# Altium schematic sheet LDCFinal1.SchDoc
size A3; SheetNumber: 1; SheetTotal: 1
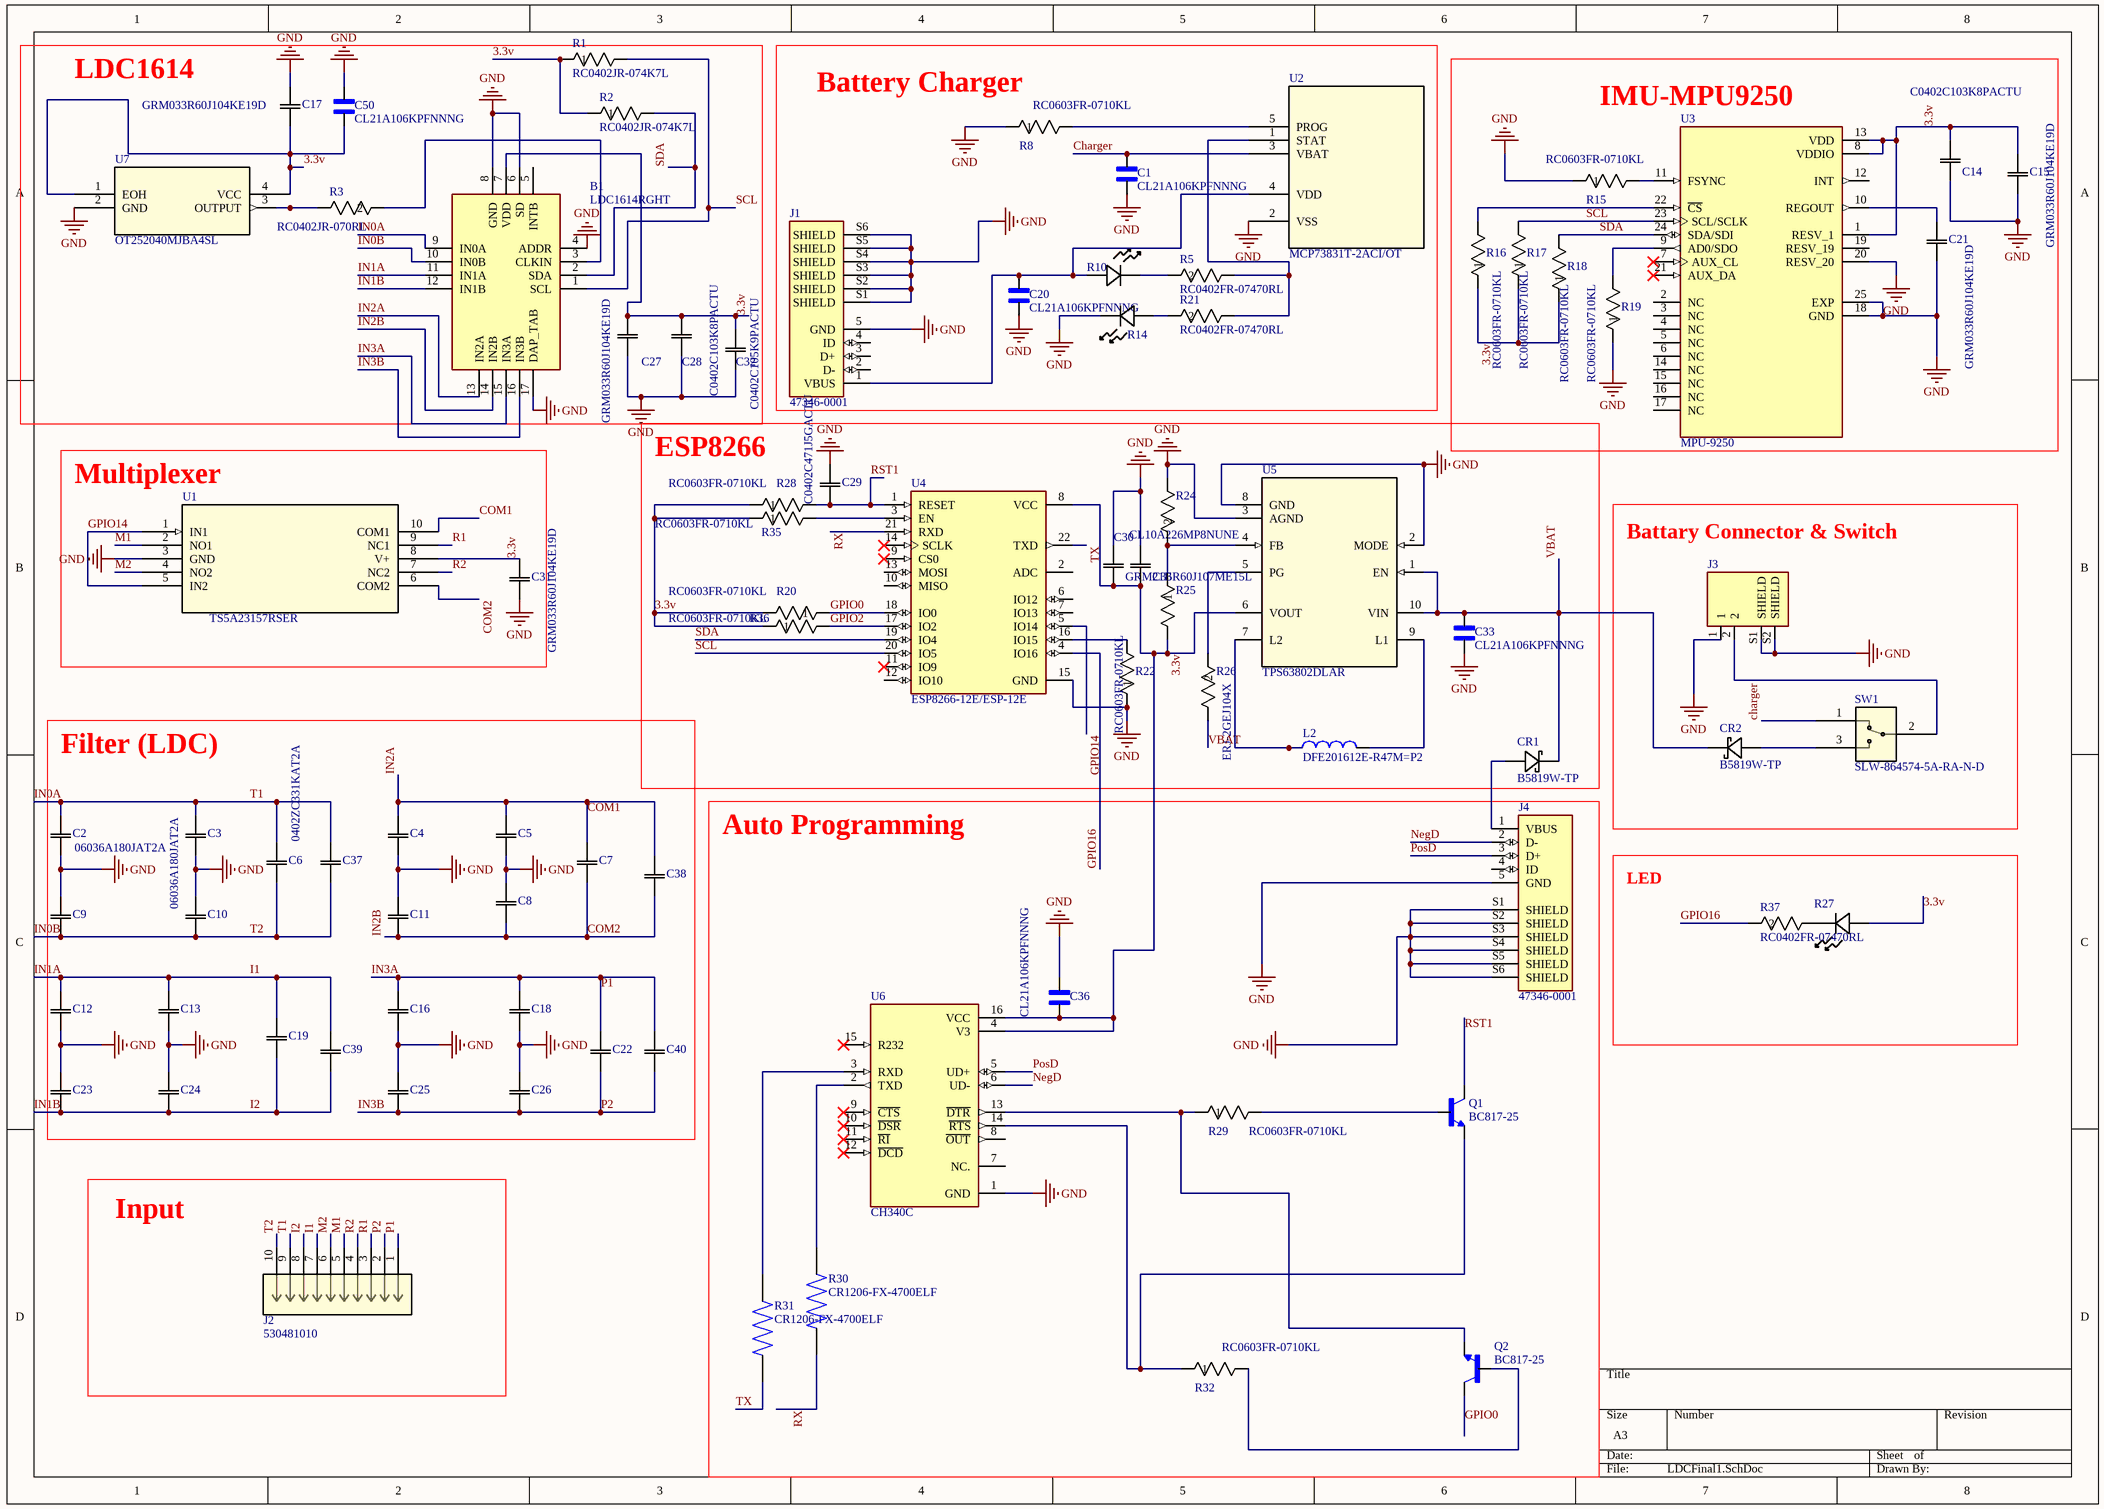
[diagram p0: LDCFinal1.SchDoc]

## Parts
B1  LDC1614RGHT  [QFN50P400X400X80-17N]
C1  CL21A106KPFNNNG  [CAPC2012X135N]
C2  06036A180JAT2A  [CAP_06033D104JAT2A]
C3  06036A180JAT2A  [CAP_06033D104JAT2A]
C4  06036A180JAT2A  [CAP_06033D104JAT2A]  (value not drawn)
C5  06036A180JAT2A  [CAP_06033D104JAT2A]  (value not drawn)
C6  0402ZC331KAT2A  [CAP_04026Z104KAT2A]
C7  0402ZC331KAT2A  [CAP_04026Z104KAT2A]  (value not drawn)
C8  06036A180JAT2A  [CAP_06033D104JAT2A]  (value not drawn)
C9  06036A180JAT2A  [CAP_06033D104JAT2A]  (value not drawn)
C10  06036A180JAT2A  [CAP_06033D104JAT2A]  (value not drawn)
C11  06036A180JAT2A  [CAP_06033D104JAT2A]  (value not drawn)
C12  06036A180JAT2A  [CAP_06033D104JAT2A]  (value not drawn)
C13  06036A180JAT2A  [CAP_06033D104JAT2A]  (value not drawn)
C14  C0402C103K8PACTU  [CAPC10555_55N_KEM-M]
C15  GRM033R60J104KE19D  [G-033_MUR]
C16  06036A180JAT2A  [CAP_06033D104JAT2A]  (value not drawn)
C17  GRM033R60J104KE19D  [G-033_MUR]
C18  06036A180JAT2A  [CAP_06033D104JAT2A]  (value not drawn)
C19  0402ZC331KAT2A  [CAP_04026Z104KAT2A]  (value not drawn)
C20  CL21A106KPFNNNG  [CAPC2012X135N]
C21  GRM033R60J104KE19D  [G-033_MUR]
C22  0402ZC331KAT2A  [CAP_04026Z104KAT2A]  (value not drawn)
C23  06036A180JAT2A  [CAP_06033D104JAT2A]  (value not drawn)
C24  06036A180JAT2A  [CAP_06033D104JAT2A]  (value not drawn)
C25  06036A180JAT2A  [CAP_06033D104JAT2A]  (value not drawn)
C26  06036A180JAT2A  [CAP_06033D104JAT2A]  (value not drawn)
C27  GRM033R60J104KE19D  [G-033_MUR]
C28  C0402C103K8PACTU  [CAPC10555_55N_KEM-M]
C29  C0402C471J5GACTU  [CAPC10555_55N_KEM]
C30  GRM21BR60J107ME15L  [CAP_GRM21B_MUR]
C31  GRM033R60J104KE19D  [G-033_MUR]
C32  C0402C105K9PACTU  [CAPC10555_55N_KEM]
C33  CL21A106KPFNNNG  [CAPC2012X135N]
C35  CL10A226MP8NUNE  [CAP_CL10_SAM]
C36  CL21A106KPFNNNG  [CAPC2012X135N]
C37  (no value)  [CAP_AR20_AVX]
C38  AR205F473K4R  [CAP_AR20_AVX]  (value not drawn)
C39  AR205F473K4R  [CAP_AR20_AVX]  (value not drawn)
C40  AR205F473K4R  [CAP_AR20_AVX]  (value not drawn)
C50  CL21A106KPFNNNG  [CAPC2012X135N]
CR1  B5819W-TP  [SDO_SOD-123_MCC]
CR2  B5819W-TP  [SDO_SOD-123_MCC]
J1  47346-0001  [MOLEX_47346-0001]
J2  530481010  [CONN10_530481010_MOL]
J3  S2B-PH-SM4-TB(LF)(SN)  [JST_S2B-PH-SM4-TB(LF)(SN)]  (value not drawn)
J4  47346-0001  [MOLEX_47346-0001]
L2  DFE201612E-R47M=P2  [INDC2016X120N]
Q1  BC817-25  [TRANS_BC817-25]
Q2  BC817-25  [TRANS_BC817-25]
R1  RC0402JR-074K7L  [RES_0402_YAG]
R2  RC0402JR-074K7L  [RES_0402_YAG]
R3  RC0402JR-070RL  [RC0402N_YAG]
R5  RC0402FR-07470RL  [RC0402N_YAG-M]
R8  RC0603FR-0710KL  [RC0603N_YAG-M]
R10  SML-D12M8WT86  [LED_SMLD12_ROM]  (value not drawn)
R14  SML-D12M8WT86  [LED_SMLD12_ROM]  (value not drawn)
R15  RC0603FR-0710KL  [RC0603N_YAG-M]
R16  RC0603FR-0710KL  [RC0603N_YAG-M]
R17  RC0603FR-0710KL  [RC0603N_YAG-M]
R18  RC0603FR-0710KL  [RC0603N_YAG-M]
R19  RC0603FR-0710KL  [RC0603N_YAG-M]
R20  RC0603FR-0710KL  [RC0603N_YAG-M]
R21  RC0402FR-07470RL  [RC0402N_YAG-M]
R22  RC0603FR-0710KL  [RC0603N_YAG-M]
R24  RC0603JR-0791KL  [RC0603N_YAG]  (value not drawn)
R25  RMCF0402FT511K  [RES_RMCF0402_STP]  (value not drawn)
R26  ERJ-2GEJ104X  [RC0402N_PAN]
R27  SML-D12M8WT86  [LED_SMLD12_ROM]  (value not drawn)
R28  RC0603FR-0710KL  [RC0603N_YAG-M]
R29  RC0603FR-0710KL  [RC0603N_YAG-M]
R30  CR1206-FX-4700ELF  [RESC3216X75N]
R31  CR1206-FX-4700ELF  [RESC3216X75N]
R32  RC0603FR-0710KL  [RC0603N_YAG-M]
R35  RC0603FR-0710KL  [RC0603N_YAG-M]
R36  RC0603FR-0710KL  [RC0603N_YAG-M]
R37  RC0402FR-07470RL  [RC0402N_YAG]
SW1  SLW-864574-5A-RA-N-D  [SLW-864574-5A-RA-N-D_SSD]
U1  TS5A23157RSER  [RSE10]
U2  MCP73831T-2ACI/OT  [SOT-23-5_MC_MCH]
U3  MPU-9250  [QFN40P300X300X105-25N]
U4  ESP8266-12E/ESP-12E  [XCVR_ESP8266-12E/ESP-12E]
U5  TPS63802DLAR  [DLA0010A]
U6  CH340C  [SOIC127P600X180-16N]
U7  OT252040MJBA4SL  [IC_625L3C040M00000_CTS]

## Blocks framed on the sheet
LDC1614: B1 C17 C27 C28 C32 C50 R1-R3 U7
Battery Charger: C1 C20 J1 R5 R8 R10 R14 R21 U2
IMU-MPU9250: C14 C15 C21 R15-R19 U3
Multiplexer: C31 U1
ESP8266: C29 C30 C33 C35 CR1 L2 R20 R22 R24-R26 R28 R35 R36 U4 U5
Battary Connector & Switch: CR2 J3 SW1
Filter (LDC): C2-C13 C16 C18 C19 C22-C26 C37-C40
Auto Programming: C36 J4 Q1 Q2 R29-R32 U6

## Nets
GND: B1.4(ADDR) B1.6(SD) B1.8(GND) B1.17(DAP_TAB) C1.1 C2.1(EPAD) C3.1(EPAD) C4.1(EPAD) C5.1(EPAD) C8.2(EPAD) C9.2(EPAD) C10.2(EPAD) C11.2(EPAD) C12.1(EPAD) C13.1(EPAD) C14.1 C15.1 C16.1(EPAD) C17.1 C18.1(EPAD) C20.1 C21.1 C23.2(EPAD) C24.2(EPAD) C25.2(EPAD) C26.2(EPAD) C27.1 C28.1 C29.2 C30.2 C31.1 C32.1 C33.1 C35.2 C36.2 C50.2 J1.5(GND) J1.S1(SHIELD) J1.S2(SHIELD) J1.S3(SHIELD) J1.S4(SHIELD) J1.S5(SHIELD) J1.S6(SHIELD) J3.1 J3.S1(SHIELD) J3.S2(SHIELD) J4.5(GND) J4.S1(SHIELD) J4.S2(SHIELD) J4.S3(SHIELD) J4.S4(SHIELD) J4.S5(SHIELD) J4.S6(SHIELD) R8.1 R14.1 R15.1 R19.1 R22.1 R24.1 U1.3(GND) U2.2(VSS) U3.18(GND) U3.20(RESV_20) U3.25(EXP) U4.15(GND) U5.2(MODE) U5.3(AGND) U5.8(GND) U6.1(GND) U7.2(GND)
3.3v: B1.7(VDD) C14.2 C15.2 C17.2 C27.2 C28.2 C30.1 C31.2 C32.2 C35.1 C36.1 C50.1 R1.1 R2.1 R16.1 R17.1 R18.1 R20.2 R25.2 R27.2 R28.1 R35.1 R36.1 U1.8(V+) U3.1(RESV_1) U3.8(VDDIO) U3.13(VDD) U4.8(VCC) U5.6(VOUT) U6.4(V3) U6.16(VCC) U7.1(EOH) U7.4(VCC)
Charger: C1.2 SW1.1 U2.3(VBAT)
COM1: B1.13(IN2A) C4.2(EPAD) C5.2(EPAD) C7.2(EPAD) C38.2 U1.10(COM1)  [also labelled IN2A]
COM2: B1.14(IN2B) C7.1(EPAD) C8.1(EPAD) C11.1(EPAD) C38.1 U1.6(COM2)  [also labelled IN2B]
GPIO0: Q2.3(C) R20.1 U4.18(IO0)
GPIO2: R36.2 U4.17(IO2)
GPIO14: U1.1(IN1) U1.5(IN2) U4.5(IO14)
GPIO16: R37.2 U4.4(IO16)
I1: B1.11(IN1A) C12.2(EPAD) C13.2(EPAD) C19.2(EPAD) C39.2 J2.7  [also labelled IN1A]
I2: B1.12(IN1B) C19.1(EPAD) C23.1(EPAD) C24.1(EPAD) C39.1 J2.8  [also labelled IN1B]
IN0A: B1.9(IN0A) C2.2(EPAD) C3.2(EPAD) C6.2(EPAD) C37.2 J2.9  [also labelled T1]
IN0B: B1.10(IN0B) C6.1(EPAD) C9.1(EPAD) C10.1(EPAD) C37.1 J2.10  [also labelled T2]
IN3A: B1.15(IN3A) C16.2(EPAD) C18.2(EPAD) C22.2(EPAD) C40.2 J2.1  [also labelled P1]
IN3B: B1.16(IN3B) C22.1(EPAD) C25.1(EPAD) C26.1(EPAD) C40.1 J2.2  [also labelled P2]
M1: J2.5 U1.2(NO1)
M2: J2.6 U1.4(NO2)
NegD: J4.2(D-) U6.6(UD-)
PosD: J4.3(D+) U6.5(UD+)
R1: J2.3 U1.9(NC1)
R2: J2.4 U1.7(NC2)
RST1: C29.1 Q1.3(C) R28.2 U4.1(RESET)
RX: R30.1 U4.21(RXD)
SCL: B1.1(SCL) R1.2 R17.2 U3.23(SCL/SCLK) U4.20(IO5)
SDA: B1.2(SDA) R2.2 R18.2 U3.24(SDA/SDI) U4.19(IO4)
TX: R31.1 U4.22(TXD)
VBAT: C33.2 CR1.1 CR2.1 R26.1 U5.1(EN) U5.10(VIN)
NetB1_3: B1.3(CLKIN) R3.2
NetC20_2: C20.2 J1.1(VBUS) R10.2 U2.4(VDD)
NetC21_2: C21.2 U3.10(REGOUT)
NetCR1_2: CR1.2 J4.1(VBUS)
NetCR2_2: CR2.2 SW1.3
NetJ3_2: J3.2 SW1.2
NetL2_1: L2.1 U5.7(L2)
NetL2_2: L2.2 U5.9(L1)
NetQ1_1: Q1.1(B) R29.2
NetQ1_2: Q1.2(E) R32.1 U6.14(~{RTS})
NetQ2_1: Q2.1(B) R32.2
NetQ2_2: Q2.2(E) R29.1 U6.13(~{DTR})
NetR3_1: R3.1 U7.3(OUTPUT)
NetR5_1: R5.1 R21.1 U2.1(STAT)
NetR5_2: R5.2 R10.1
NetR8_2: R8.2 U2.5(PROG)
NetR14_2: R14.2 R21.2
NetR15_2: R15.2 U3.11(FSYNC)
NetR16_2: R16.2 U3.22(~{CS})
NetR19_2: R19.2 U3.9(AD0/SDO)
NetR22_2: R22.2 U4.16(IO15)
NetR24_2: R24.2 R25.1 U5.4(FB)
NetR26_2: R26.2 U5.5(PG)
NetR27_1: R27.1 R37.1
NetR30_2: R30.2 U6.2(TXD)
NetR31_2: R31.2 U6.3(RXD)
NetR35_2: R35.2 U4.3(EN)

Not connected (* = marked no-connect by the designer): B1 5(INTB); J1 2(D-) 3(D+) 4(ID); J4 4(ID); U3 2(NC) 3(NC) 4(NC) 5(NC) 6(NC) 7(AUX_CL)* 12(INT) 14(NC) 15(NC) 16(NC) 17(NC) 19(RESV_19) 21(AUX_DA)*; U4 2(ADC) 6(IO12) 7(IO13) 9(CS0)* 10(MISO) 11(IO9)* 12(IO10) 13(MOSI) 14(SCLK)*; U6 7(NC.) 8(~{OUT}) 9(~{CTS})* 10(~{DSR})* 11(~{RI})* 12(~{DCD})* 15(R232)*

## Notes on the sheet
- (near R37) LED
- Input

## Library data of the parts
B1 = LDC1614RGHT: 4-channel, 28-bit Inductance-to-Digital Converter with I2C for Inductive Sensing; Manufacturer_Name: Texas Instruments; Geometry.Height: 0.8mm; Utmel Part Number: *; Utmel Price/Stock: *; Manufacturer_Part_Number: LDC1614RGHT; Datasheet Link: http://www.ti.com/lit/ds/symlink/ldc1614.pdf
C1 C20 C33 C36 C50 = CL21A106KPFNNNG: CL21 Series 10 uF 10 V Â±10 % Tol. X5R SMT Multilayer Ceramic Capacitor; MF: Samsung Electro-Mechanics; SnapEDA_Link: https://www.snapeda.com/parts/CL21A106KPFNNNG/Samsung/view-part/?ref=snap; Package: SMD-2 Samsung; Value: *; MP: CL21A106KPFNNNG; Check_prices: https://www.snapeda.com/parts/CL21A106KPFNNNG/Samsung/view-part/?ref=eda
C2 = 06036A180JAT2A: 18pF; Manufacturer_Name: KYOCERA AVX; Copyright: Copyright (C) 2026 Ultra Librarian. All rights reserved.; Manufacturer_Part_Number: 06036A180JAT2A
C3-C5 C8-C13 C16 C18 C23-C26 = 06036A180JAT2A: Description; Manufacturer_Name: KYOCERA AVX; Copyright: Copyright (C) 2026 Ultra Librarian. All rights reserved.; Manufacturer_Part_Number: 06036A180JAT2A
C6 C7 C19 C22 = 0402ZC331KAT2A: No Description Available; Manufacturer_Name: KYOCERA AVX; Copyright: Copyright (C) 2026 Ultra Librarian. All rights reserved.; Manufacturer_Part_Number: 0402ZC331KAT2A
C14 C28 = C0402C103K8PACTU: SMD Comm X5R, Ceramic, 0.01 uF, 10%, 10 VDC, X5R, SMD, MLCC, Temperature Stable, Class II, 0402; Manufacturer_Name: Kemet; Copyright: Copyright (C) 2026 Ultra Librarian. All rights reserved.; Manufacturer_Part_Number: C0402C103K8PACTU; Datasheet: https://content.kemet.com/datasheets/KEM_C1006_X5R_SMD.pdf
C15 C17 C21 C27 C31 = GRM033R60J104KE19D: Description; Manufacturer_Name: Murata; Copyright: Copyright (C) 2025 Ultra Librarian. All rights reserved.; Manufacturer_Part_Number: GRM033R60J104KE19D
C29 = C0402C471J5GACTU: SMD Comm C0G, Ceramic, 470 pF, 5%, 50 VDC, C0G, SMD, MLCC, Ultra-Stable, Low Loss, Class I, 0402; Manufacturer_Name: Kemet; Copyright: Copyright (C) 2025 Ultra Librarian. All rights reserved.; Manufacturer_Part_Number: C0402C471J5GACTU
C30 = GRM21BR60J107ME15L: CAP CER 100UF 6.3V X5R 0805; Manufacturer_Name: Murata; Copyright: Copyright (C) 2025 Ultra Librarian. All rights reserved.; Manufacturer_Part_Number: GRM21BR60J107ME15L
C32 = C0402C105K9PACTU: SMD Comm X5R, Ceramic, 1 uF, 10%, 6.3 VDC, X5R, SMD, MLCC, Temperature Stable, Class II, 0402; Manufacturer_Name: Kemet; Copyright: Copyright (C) 2025 Ultra Librarian. All rights reserved.; Manufacturer_Part_Number: C0402C105K9PACTU
C35 = CL10A226MP8NUNE: Description; Manufacturer_Name: Samsung; Copyright: Copyright (C) 2025 Ultra Librarian. All rights reserved.; Manufacturer_Part_Number: CL10A226MP8NUNE
C37-C40 = AR205F473K4R: No Description Available; Manufacturer_Name: KYOCERA AVX; Copyright: Copyright (C) 2026 Ultra Librarian. All rights reserved.; Manufacturer_Part_Number: AR205F473K4R
CR1 CR2 = B5819W-TP: Description; Manufacturer_Name: MCC; Copyright: Copyright (C) 2025 Ultra Librarian. All rights reserved.; Manufacturer_Part_Number: B5819W-TP
J1 J4 = 47346-0001: Conn Data USB Micro B w/Flange SMT Bottom Mnt LF | Molex Incorporated 47346-0001; SnapEDA_Link: https://www.snapeda.com/parts/47346-0001/Molex/view-part/?ref=snap; Package: None; Value: *; MF: Molex; MP: 47346-0001; Check_prices: https://www.snapeda.com/parts/47346-0001/Molex/view-part/?ref=eda
J2 = 530481010: 1.25mm Pitch, PicoBlade PCB Header, Single Row, Right-Angle, Through Hole, Tin (Sn) Plating, Friction Lock,  10 Circuits, Tray, 2.30mm PC Tail Length; Manufacturer_Name: Molex Connector Corporation; Copyright: Copyright (C) 2025 Ultra Librarian. All rights reserved.; Manufacturer_Part_Number: 530481010; RefDes: RefDes; Type: Type
J3 = S2B-PH-SM4-TB(LF)(SN): Connector Header Surface Mount, Right Angle 2 position 0.079 (2.00mm); MF: JST Sales; Value: *; SnapEDA_Link: https://www.snapeda.com/parts/S2B-PH-SM4-TB(LF)(SN)/JST+Sales+America+Inc./view-part/?ref=snap; Purchase-URL: https://pricing.snapeda.com/search/part/S2B-PH-SM4-TB(LF)(SN)/?ref=eda; Check_prices: https://www.snapeda.com/parts/S2B-PH-SM4-TB(LF)(SN)/JST+Sales+America+Inc./view-part/?ref=eda; Digi-Key_Part_Number: 455-1749-2-ND; Package: None; MP: S2B-PH-SM4-TB(LF)(SN)
L2 = DFE201612E-R47M=P2: Inductor with Inductance: 0.47uH Tol. +/-20%, Package: 0806 (2016); MF: Murata; Check_prices: https://www.snapeda.com/parts/DFE201612E-R47M=P2/Murata/view-part/?ref=eda; Value: *; MP: DFE201612E-R47M=P2; Purchase-URL: https://pricing.snapeda.com/search/part/DFE201612E-R47M=P2/?ref=eda; SnapEDA_Link: https://www.snapeda.com/parts/DFE201612E-R47M=P2/Murata/view-part/?ref=snap; Package: 2016 Murata; Digi-Key_Part_Number: 490-DFE201612E-R47M=P2TR-ND
Q1 Q2 = BC817-25: Bipolar (BJT) Transistor NPN 45 V 500 mA 100MHz 900 mW Surface Mount DFN1010D-3; MF: Nexperia USA; SnapEDA_Link: https://www.snapeda.com/parts/BC817-25/Nexperia/view-part/?ref=snap; Package: SOT-23-3 Nexperia USA; Value: *; MP: BC817-25; Check_prices: https://www.snapeda.com/parts/BC817-25/Nexperia/view-part/?ref=eda
R1 R2 = RC0402JR-074K7L: No Description Available; Manufacturer_Name: Yageo; Copyright: Copyright (C) 2026 Ultra Librarian. All rights reserved.; Manufacturer_Part_Number: RC0402JR-074K7L
R3 = RC0402JR-070RL: RES; SMT (0402); 0; 5%; JUMPER; 0.0630W; Manufacturer_Name: Yageo; Copyright: Copyright (C) 2025 Ultra Librarian. All rights reserved.; Manufacturer_Part_Number: RC0402JR-070RL
R5 R21 R37 = RC0402FR-07470RL: Description; Manufacturer_Name: Yageo; Copyright: Copyright (C) 2025 Ultra Librarian. All rights reserved.; Manufacturer_Part_Number: RC0402FR-07470RL
R8 R15-R20 R22 R28 R29 R32 R35 R36 = RC0603FR-0710KL: RES SMD 10kO 1% 1/10W 0603; Manufacturer_Name: Yageo; Copyright: Copyright (C) 2025 Ultra Librarian. All rights reserved.; Manufacturer_Part_Number: RC0603FR-0710KL
R10 R14 R27 = SML-D12M8WT86: Description; Manufacturer_Name: ROHM Semiconductor; Copyright: Copyright (C) 2026 Ultra Librarian. All rights reserved.; Manufacturer_Part_Number: SML-D12M8WT86
R24 = RC0603JR-0791KL: No Description Available; Manufacturer_Name: Yageo; Copyright: Copyright (C) 2026 Ultra Librarian. All rights reserved.; Manufacturer_Part_Number: RC0603JR-0791KL
R25 = RMCF0402FT511K: No Description Available; Manufacturer_Name: Stackpole International; Copyright: Copyright (C) 2026 Ultra Librarian. All rights reserved.; Manufacturer_Part_Number: RMCF0402FT511K
R26 = ERJ-2GEJ104X: RESISTOR; 0402; 100K OHM; 5%; 200PPM; 0.10W; THICK FILM; Manufacturer_Name: Panasonic; Copyright: Copyright (C) 2025 Ultra Librarian. All rights reserved.; Manufacturer_Part_Number: ERJ-2GEJ104X
R30 R31 = CR1206-FX-4700ELF: RESISTOR THICK FILM, 470 OHM, 1%, 1206; Product Range:BOURNS - CR Series; Resistance:470ohm; Power Rating:250mW; Resistance Tolerance:Â± 1%; Resistor Case Style:1206 [3216 Metric]; Resistor Element Material:Thick Film; Temperature Coefficient:Â± 100ppm/Â°; MF: Bourns; SnapEDA_Link: https://www.snapeda.com/parts/CR1206-FX-4700ELF/Bourns/view-part/?ref=snap; Package: 3216 Bourns; Value: *; MP: CR1206-FX-4700ELF; Check_prices: https://www.snapeda.com/parts/CR1206-FX-4700ELF/Bourns/view-part/?ref=eda
SW1 = SLW-864574-5A-RA-N-D: Description; Manufacturer_Name: Same Sky; Copyright: Copyright (C) 2025 Ultra Librarian. All rights reserved.; Manufacturer_Part_Number: SLW-864574-5A-RA-N-D; RefDes: RefDes; Type: Type
U1 = TS5A23157RSER: 5V, 2:1 (SPDT), 2-channel, analog switch 10-UQFN -40 to 125; Manufacturer_Name: Texas Instruments; Copyright: Copyright (C) 2026 Ultra Librarian. All rights reserved.; Manufacturer_Part_Number: TS5A23157RSER; RefDes: RefDes; Type: Type
U2 = MCP73831T-2ACIOT: Description; Manufacturer_Name: Microchip; Copyright: Copyright (C) 2026 Ultra Librarian. All rights reserved.; Manufacturer_Part_Number: MCP73831T-2ACI/OT; RefDes: RefDes; Type: Type
U3 = MPU-9250: MPU-9250 series Accelerometer, Gyroscope, Humidity, Magnetometer, Pressure, Temperature Sensor Evaluation Board; MF: TDK InvenSense; SnapEDA_Link: https://www.snapeda.com/parts/MPU-9250/TDK+InvenSense/view-part/?ref=snap; Package: TFQFN-24 TDK InvenSense; Value: *; MP: MPU-9250; Check_prices: https://www.snapeda.com/parts/MPU-9250/TDK+InvenSense/view-part/?ref=eda
U4 = ESP8266-12E/ESP-12E: This WiFi module has a 32-bit MCU micro and clock speeds supporting 80 MHz or 160 MHz. Supports the RTOS and integrated Wi-Fi MAC/BB/RF/PA/LNA, and has an on-board antenna.; MF: AI-Thinker; Value: *; SnapEDA_Link: https://www.snapeda.com/parts/ESP8266-12E/ESP-12E/AI-Thinker/view-part/?ref=snap; Availability: Not in stock; Price: None; Package: None; Check_prices: https://www.snapeda.com/parts/ESP8266-12E/ESP-12E/AI-Thinker/view-part/?ref=eda; MP: ESP8266-12E/ESP-12E
U5 = TPS63802DLAR: 2-A, high-efficient, 11-ÂµA quiescent current buck-boost converter in QFN/DFN package 10-VSON-HR -40 to 125; Manufacturer_Name: Texas Instruments; TYPE: TYPE; RefDes: RefDes; Copyright: Copyright (C) 2025 Ultra Librarian. All rights reserved.; Manufacturer_Part_Number: TPS63802DLAR
U6 = CH340C: USB to serial chip CH340; MF: WCH; Price: None; Availability: Not in stock; MP: CH340C; Package: None; SnapEDA_Link: https://www.snapeda.com/parts/CH340C/WCH/view-part/?ref=snap; Check_prices: https://www.snapeda.com/parts/CH340C/WCH/view-part/?ref=eda; Value: *
U7 = 625L3C040M00000: Description; Manufacturer_Name: CTS Components; Copyright: Copyright (C) 2025 Ultra Librarian. All rights reserved.; Manufacturer_Part_Number: 625L3C040M00000; RefDes: RefDes; Type: Type